# Altium schematic sheet 02_Diagram.SchDoc
size 513 x 386 mm; DsnPath: C:\Users\nilot\Documents\VSCode\SBC\imports\SG2002_QFN88_38_20230301_4L_V1.3_16.2.DSN; SchematicName: CV181xC_QFN88_38_DemoBoard; PageName: 02_Diagram; PageSize: C; TopSchematic: True
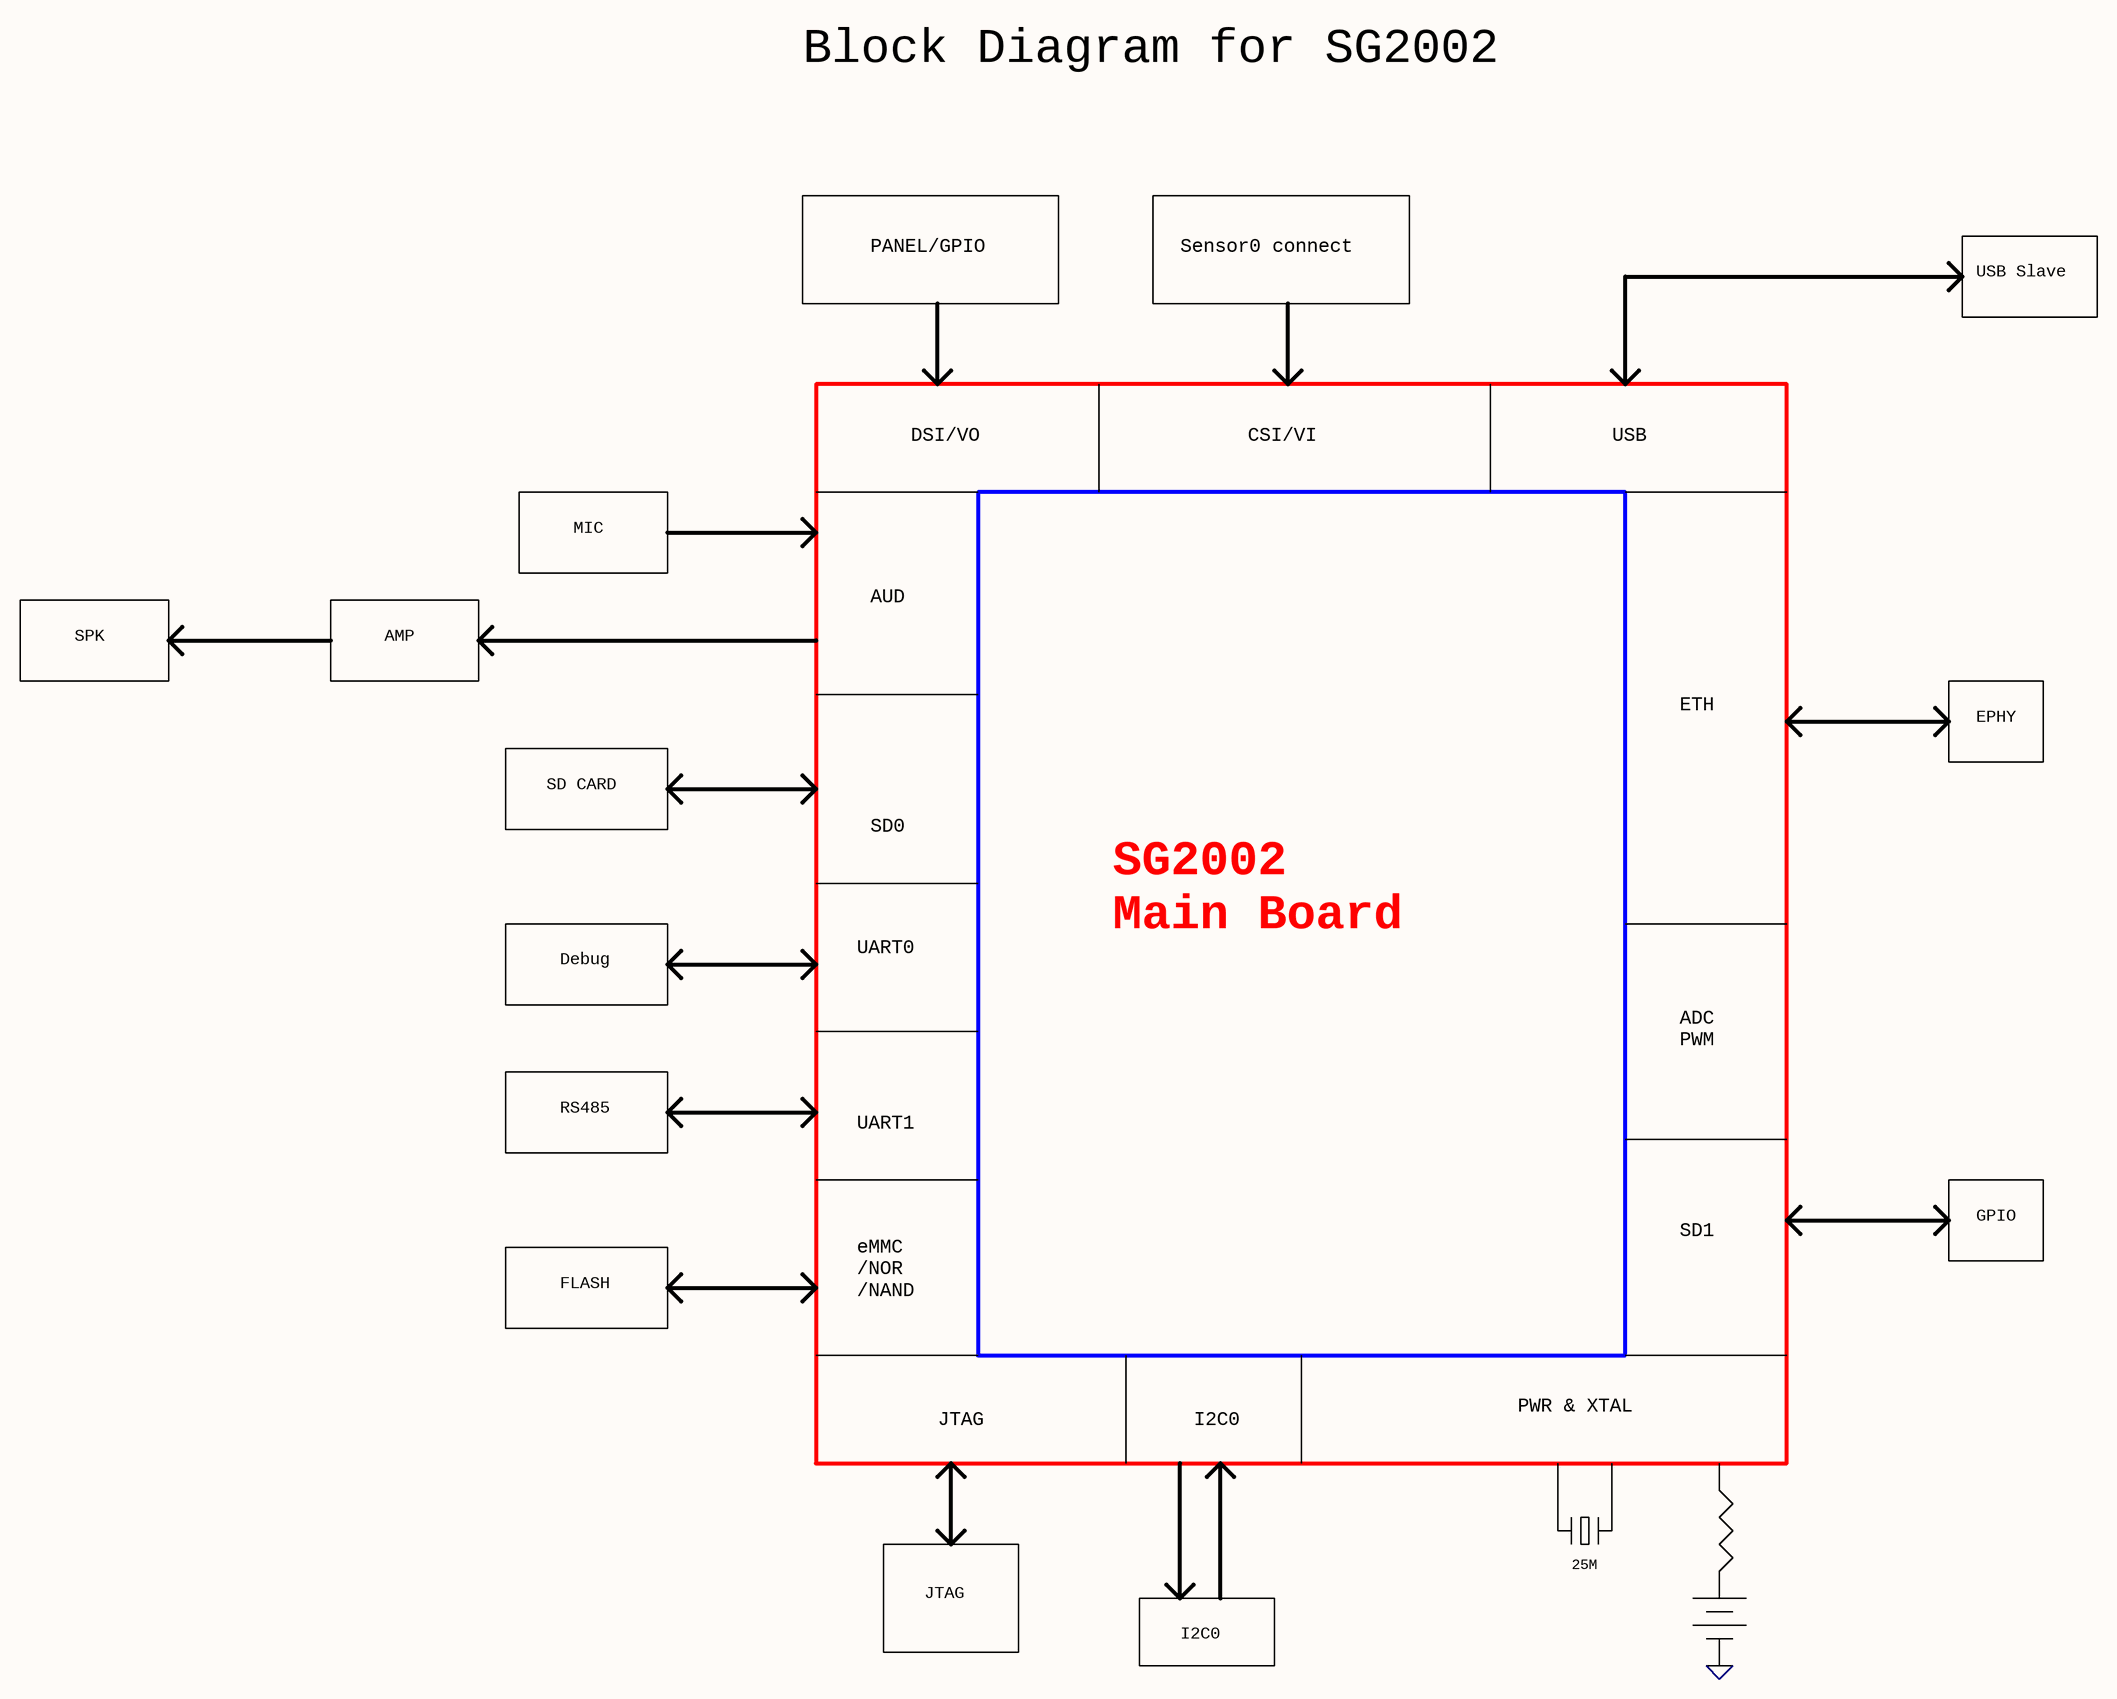
[diagram p0: 02_Diagram.SchDoc]

## Notes on the sheet
- Block Diagram for SG2002
- PANEL/GPIO
- Sensor0 connect
- USB Slave
- DSI/VO
- CSI/VI
- USB
- MIC
- AUD
- SPK
- AMP
- ETH
- EPHY
- SD CARD
- SG2002
  Main Board
- SD0
- Debug
- UART0
- ADC
  PWM
- RS485
- UART1
- eMMC
  /NOR
  /NAND
- GPIO
- FLASH
- SD1
- JTAG
- I2C0
- PWR & XTAL
- 25M